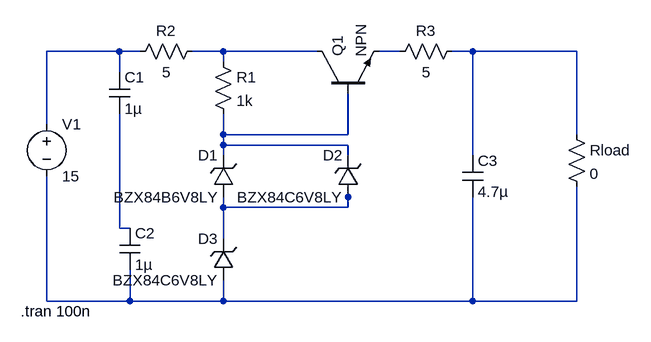
[diagram p0: schematic bjt as protection device.asc]
bjt as protection device.asc, the LTspice schematic file:
Version 4.1
SHEET 1 952 680
WIRE 160 0 48 0
WIRE 192 0 160 0
WIRE 320 0 272 0
WIRE 464 0 320 0
WIRE 592 0 560 0
WIRE 704 0 672 0
WIRE 864 0 704 0
WIRE 320 16 320 0
WIRE 160 32 160 0
WIRE 48 112 48 0
WIRE 320 128 320 96
WIRE 512 128 512 64
WIRE 512 128 320 128
WIRE 864 128 864 0
WIRE 320 144 320 128
WIRE 512 144 320 144
WIRE 320 160 320 144
WIRE 512 160 512 144
WIRE 704 160 704 0
WIRE 512 224 512 208
WIRE 320 240 320 224
WIRE 512 240 512 224
WIRE 512 240 320 240
WIRE 160 272 160 96
WIRE 176 272 160 272
WIRE 320 288 320 240
WIRE 48 384 48 192
WIRE 176 384 176 336
WIRE 176 384 48 384
WIRE 320 384 320 352
WIRE 320 384 176 384
WIRE 704 384 704 224
WIRE 704 384 320 384
WIRE 864 384 864 208
WIRE 864 384 704 384
SYMBOL voltage 48 96 R0
WINDOW 123 0 0 Left 0
WINDOW 39 0 0 Left 0
SYMATTR InstName V1
SYMATTR Value 15
SYMBOL npn 464 64 R270
SYMATTR InstName Q1
SYMBOL res 304 0 R0
SYMATTR InstName R1
SYMATTR Value 1k
SYMBOL cap 144 32 R0
SYMATTR InstName C1
SYMATTR Value 1µ
SYMBOL cap 160 272 R0
SYMATTR InstName C2
SYMATTR Value 1µ
SYMBOL cap 688 160 R0
SYMATTR InstName C3
SYMATTR Value 4.7µ
SYMBOL zener 336 224 R180
WINDOW 0 24 64 Left 2
WINDOW 3 24 0 Left 2
SYMATTR InstName D1
SYMATTR Value BZX84B6V8LY
SYMBOL zener 528 224 R180
WINDOW 0 24 64 Left 2
WINDOW 3 24 0 Left 2
SYMATTR InstName D2
SYMATTR Value BZX84C6V8LY
SYMBOL zener 336 352 R180
WINDOW 0 24 64 Left 2
WINDOW 3 24 0 Left 2
SYMATTR InstName D3
SYMATTR Value BZX84C6V8LY
SYMBOL res 848 112 R0
SYMATTR InstName Rload
SYMATTR Value 0
SYMBOL res 288 -16 R90
WINDOW 0 0 56 VBottom 2
WINDOW 3 32 56 VTop 2
SYMATTR InstName R2
SYMATTR Value 5
SYMBOL res 688 -16 R90
WINDOW 0 0 56 VBottom 2
WINDOW 3 32 56 VTop 2
SYMATTR InstName R3
SYMATTR Value 5
TEXT 8 400 Left 2 !.tran 100n

The netlist it stands for:
* bjt as protection device.asc
V1 N001 N008 15
Q1 N002 N005 N003 0 NPN
R1 N002 N005 1k
C1 N001 N007 1µ
C2 N007 N008 1µ
C3 N004 N008 4.7µ
D1 N006 N005 BZX84B6V8LY
D2 N006 N005 BZX84C6V8LY
D3 N008 N006 BZX84C6V8LY
Rload N004 N008 0
R2 N002 N001 5
R3 N004 N003 5
.model D D
.lib standard.dio
.model NPN NPN
.model PNP PNP
.lib standard.bjt
.tran 100n
.backanno
.end